# EAGLE design mbc_93_24_05_01 (EAGLE 7.6.0)

## Sheet 1 of 3
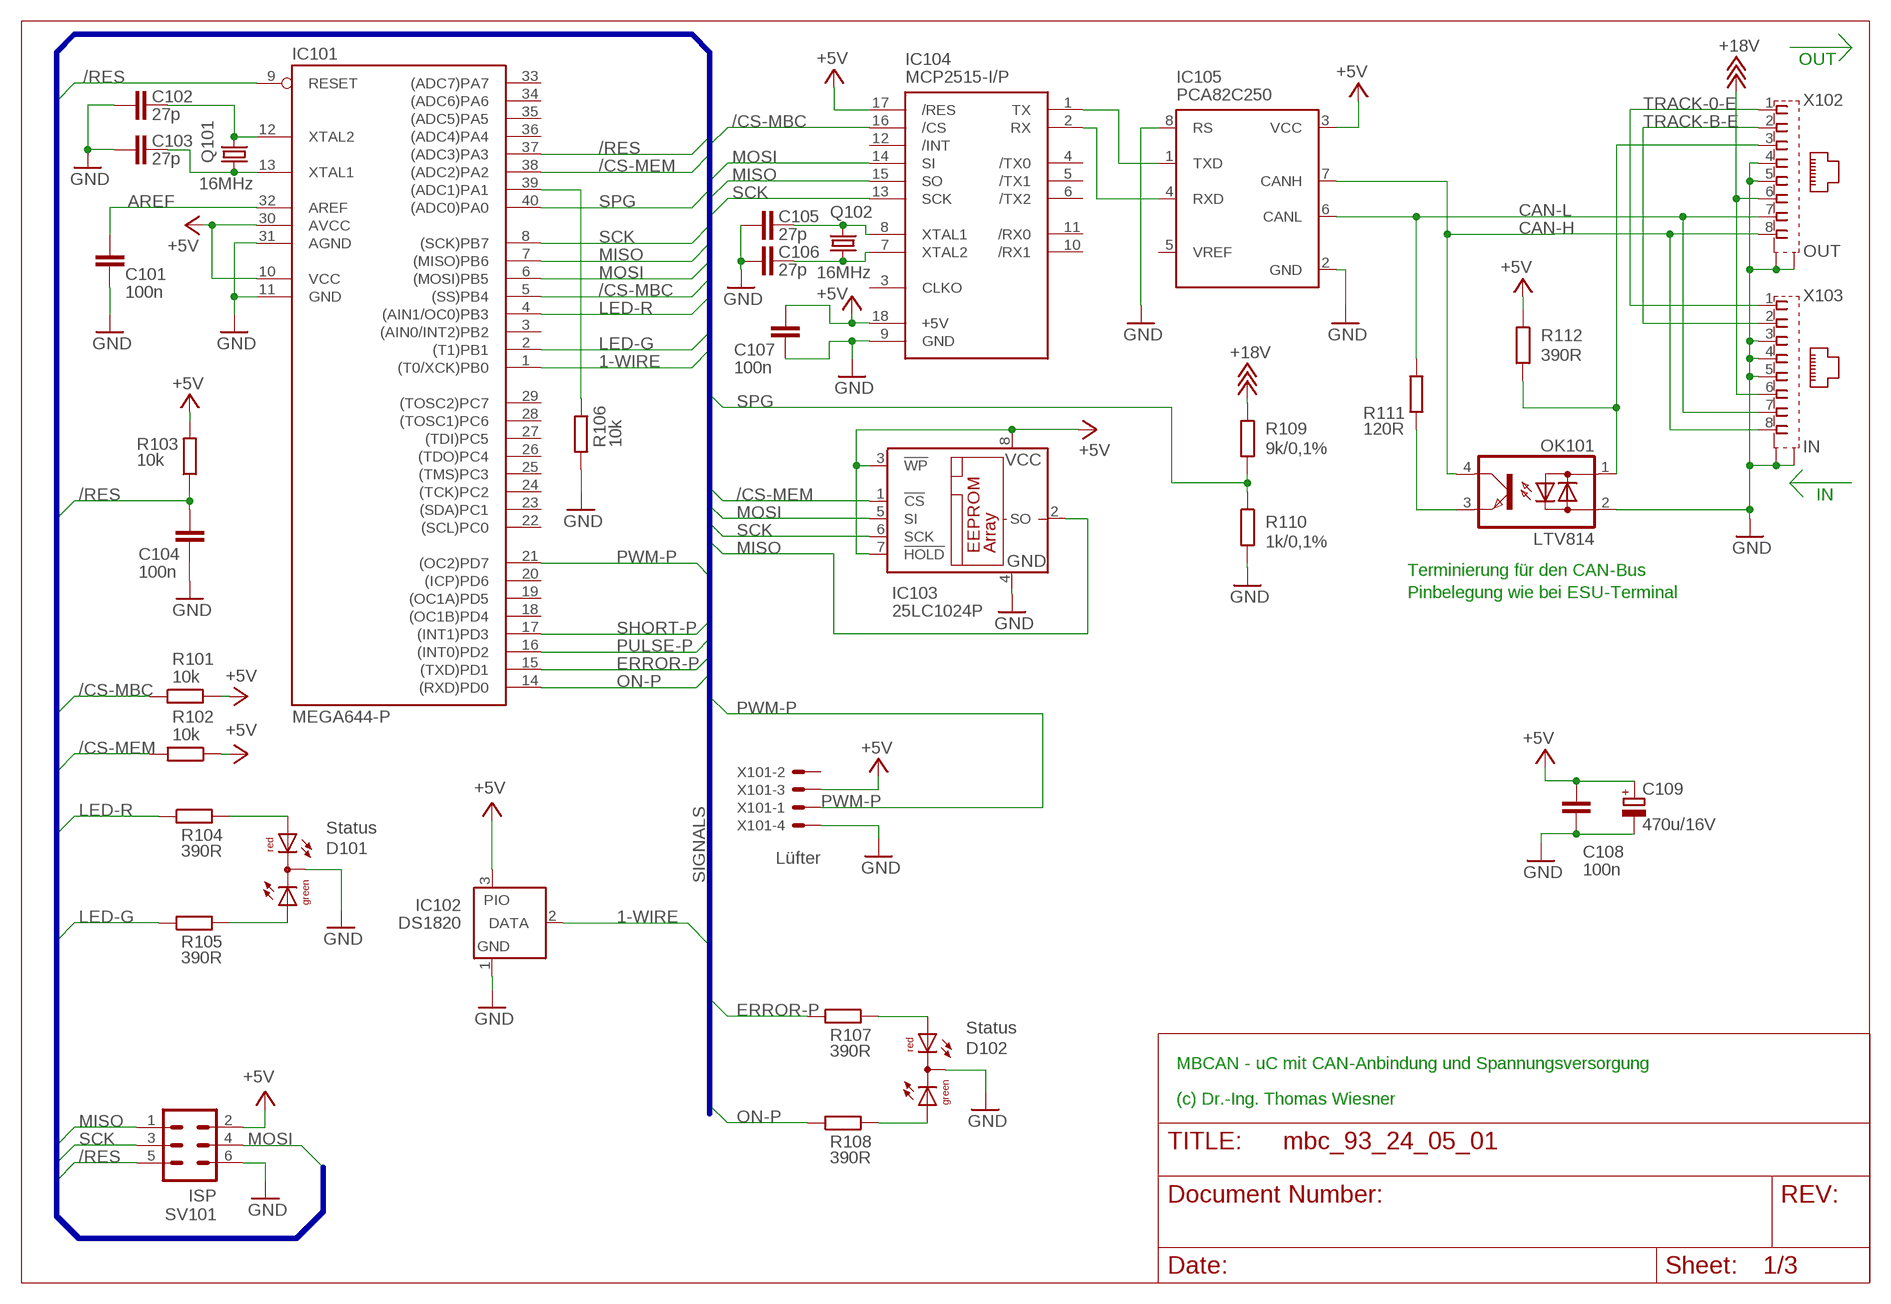
[diagram p0: schematic, sheet 1]

### Parts
C101  100n  C-EU025-025X050  [C025-025X050]
C102  27p  C-EU025-025X050  [C025-025X050]
C103  27p  C-EU025-025X050  [C025-025X050]
C104  100n  C-EU025-025X050  [C025-025X050]
C105  27p  C-EU025-025X050  [C025-025X050]
C106  27p  C-EU025-025X050  [C025-025X050]
C107  100n  C-EU025-025X050  [C025-025X050]
C108  100n  C-EU025-025X050  [C025-025X050]
C109  470u/16V  CPOL-EUE3.5-8  [E3,5-8]
D101  Status  DUOLED5MM  [DUOLED5MM]
D102  Status  DUOLED5MM  [DUOLED5MM]
IC101  MEGA644-P  MEGA323-P  [DIL40]
IC102  DS1820  DS2405  [TO92-]
IC103  25LC1024P  25LC040P  [DIL8]
IC104  MCP2515-I/P  MCP2510-I/P  [DIL18]
IC105  PCA82C250  [DIL08]
OK101  LTV814  PC814  [DIL04]
Q101  16MHz  CRYSTALHC49U-V  [HC49U-V]
Q102  16MHz  CRYSTALHC49U-V  [HC49U-V]
R101  10k  R-EU_0207/10  [0207/10]
R102  10k  R-EU_0207/10  [0207/10]
R103  10k  R-EU_0207/10  [0207/10]
R104  390R  R-EU_0207/10  [0207/10]
R105  390R  R-EU_0207/10  [0207/10]
R106  10k  R-EU_0207/10  [0207/10]
R107  390R  R-EU_0207/10  [0207/10]
R108  390R  R-EU_0207/10  [0207/10]
R109  9k/0,1%  R-EU_0207/10  [0207/10]
R110  1k/0,1%  R-EU_0207/10  [0207/10]
R111  120R  R-EU_0207/10  [0207/10]
R112  390R  R-EU_0207/10  [0207/10]
SV101  ISP  ML6  [ML6]
X101  Lüfter  22-23-2041  [22-23-2041]
X102  OUT  0446200002  [0446200002]
X103  IN  0446200002  [0446200002]

### Nets
1-WIRE: IC101.1((T0/XCK)PB0) IC102.2(DATA)
+5V: C107.1 C108.1 C109.+ IC101.10(VCC) IC101.30(AVCC) IC102.3(PIO) IC103.3(!WP) IC103.7(!HOLD) IC103.8(VCC) IC104.17(/RES) IC104.18(+5V) IC105.3(VCC) R101.2 R102.1 R103.2 R112.1 SV101.2 X101.3 ; also sheet 2,3
+18V: R109.1 X102.6 X103.6
/CS-MBC: IC101.5((SS)PB4) IC104.16(/CS) R101.1
/CS-MEM: IC101.38((ADC2)PA2) IC103.1(!CS) R102.2
/RES: C104.1 IC101.9(RESET) IC101.37((ADC3)PA3) R103.1 SV101.5
AREF: C101.1 IC101.32(AREF)
CAN-H: IC105.7(CANH) OK101.4(C) X102.8 X103.8
CAN-L: IC105.6(CANL) R111.2 X102.7 X103.7
ERROR-P: IC101.15((TXD)PD1) R107.1
GND: C101.2 C102.2 C103.2 C104.2 C105.2 C106.2 C107.2 C108.2 C109.- D101.K(C) D102.K(C) IC101.11(GND) IC101.31(AGND) IC102.1(GND) IC103.4(GND) IC104.9(GND) IC105.2(GND) IC105.8(RS) OK101.2(AC2) R106.1 R110.2 SV101.6 X101.4 X102.4 X102.5 X102.S@1(S1) X102.S@2(S2) X103.3 X103.4 X103.5 X103.S@1(S1) X103.S@2(S2) ; also sheet 2,3
LED-G: IC101.2((T1)PB1) R105.1
LED-R: IC101.4((AIN1/OC0)PB3) R104.1
MISO: IC101.7((MISO)PB6) IC103.2(SO) IC104.15(SO) SV101.1
MOSI: IC101.6((MOSI)PB5) IC103.5(SI) IC104.14(SI) SV101.4
N$1: C103.1 IC101.13(XTAL1) Q101.1
N$5: C102.1 IC101.12(XTAL2) Q101.2
N$6: C105.1 IC104.8(XTAL1) Q102.2
N$7: C106.1 IC104.7(XTAL2) Q102.1
N$9: IC101.39((ADC1)PA1) R106.2
N$23: D101.AR R104.2
N$27: D101.AG R105.2
N$29: IC104.1(TX) IC105.1(TXD)
N$30: IC104.2(RX) IC105.4(RXD)
N$32: OK101.3(E) R111.1
N$33: OK101.1(AC1) R112.2 X102.3
N$55: D102.AR R107.2
N$56: D102.AG R108.2
ON-P: IC101.14((RXD)PD0) R108.1 ; also sheet 2,3
PULSE-P: IC101.16((INT0)PD2) ; also sheet 2
PWM-P: IC101.21((OC2)PD7) X101.1
SCK: IC101.8((SCK)PB7) IC103.6(SCK) IC104.13(SCK) SV101.3
SHORT-P: IC101.17((INT1)PD3) ; also sheet 2,3
SPG: IC101.40((ADC0)PA0) R109.2 R110.1
TRACK-0-E: X102.1 X103.1 ; also sheet 2
TRACK-B-E: X102.2 X103.2 ; also sheet 2
Unconnected: IC101.3((AIN0/INT2)PB2) IC101.18((OC1B)PD4) IC101.19((OC1A)PD5) IC101.20((ICP)PD6) IC101.22((SCL)PC0) IC101.23((SDA)PC1) IC101.24((TCK)PC2) IC101.25((TMS)PC3) IC101.26((TDO)PC4) IC101.27((TDI)PC5) IC101.28((TOSC1)PC6) IC101.29((TOSC2)PC7) IC101.33((ADC7)PA7) IC101.34((ADC6)PA6) IC101.35((ADC5)PA5) IC101.36((ADC4)PA4) IC104.3(CLKO) IC104.4(/TX0) IC104.5(/TX1) IC104.6(/TX2) IC104.10(/RX1) IC104.11(/RX0) IC104.12(/INT) IC105.5(VREF) X101.2

### Buses
SIGNALS

### Notes on the sheet
- OUT
- IN
- Terminierung für den CAN-Bus
- Pinbelegung wie bei ESU-Terminal
- MBCAN - uC mit CAN-Anbindung und Spannungsversorgung
- (c) Dr.-Ing. Thomas Wiesner

## Sheet 2 of 3
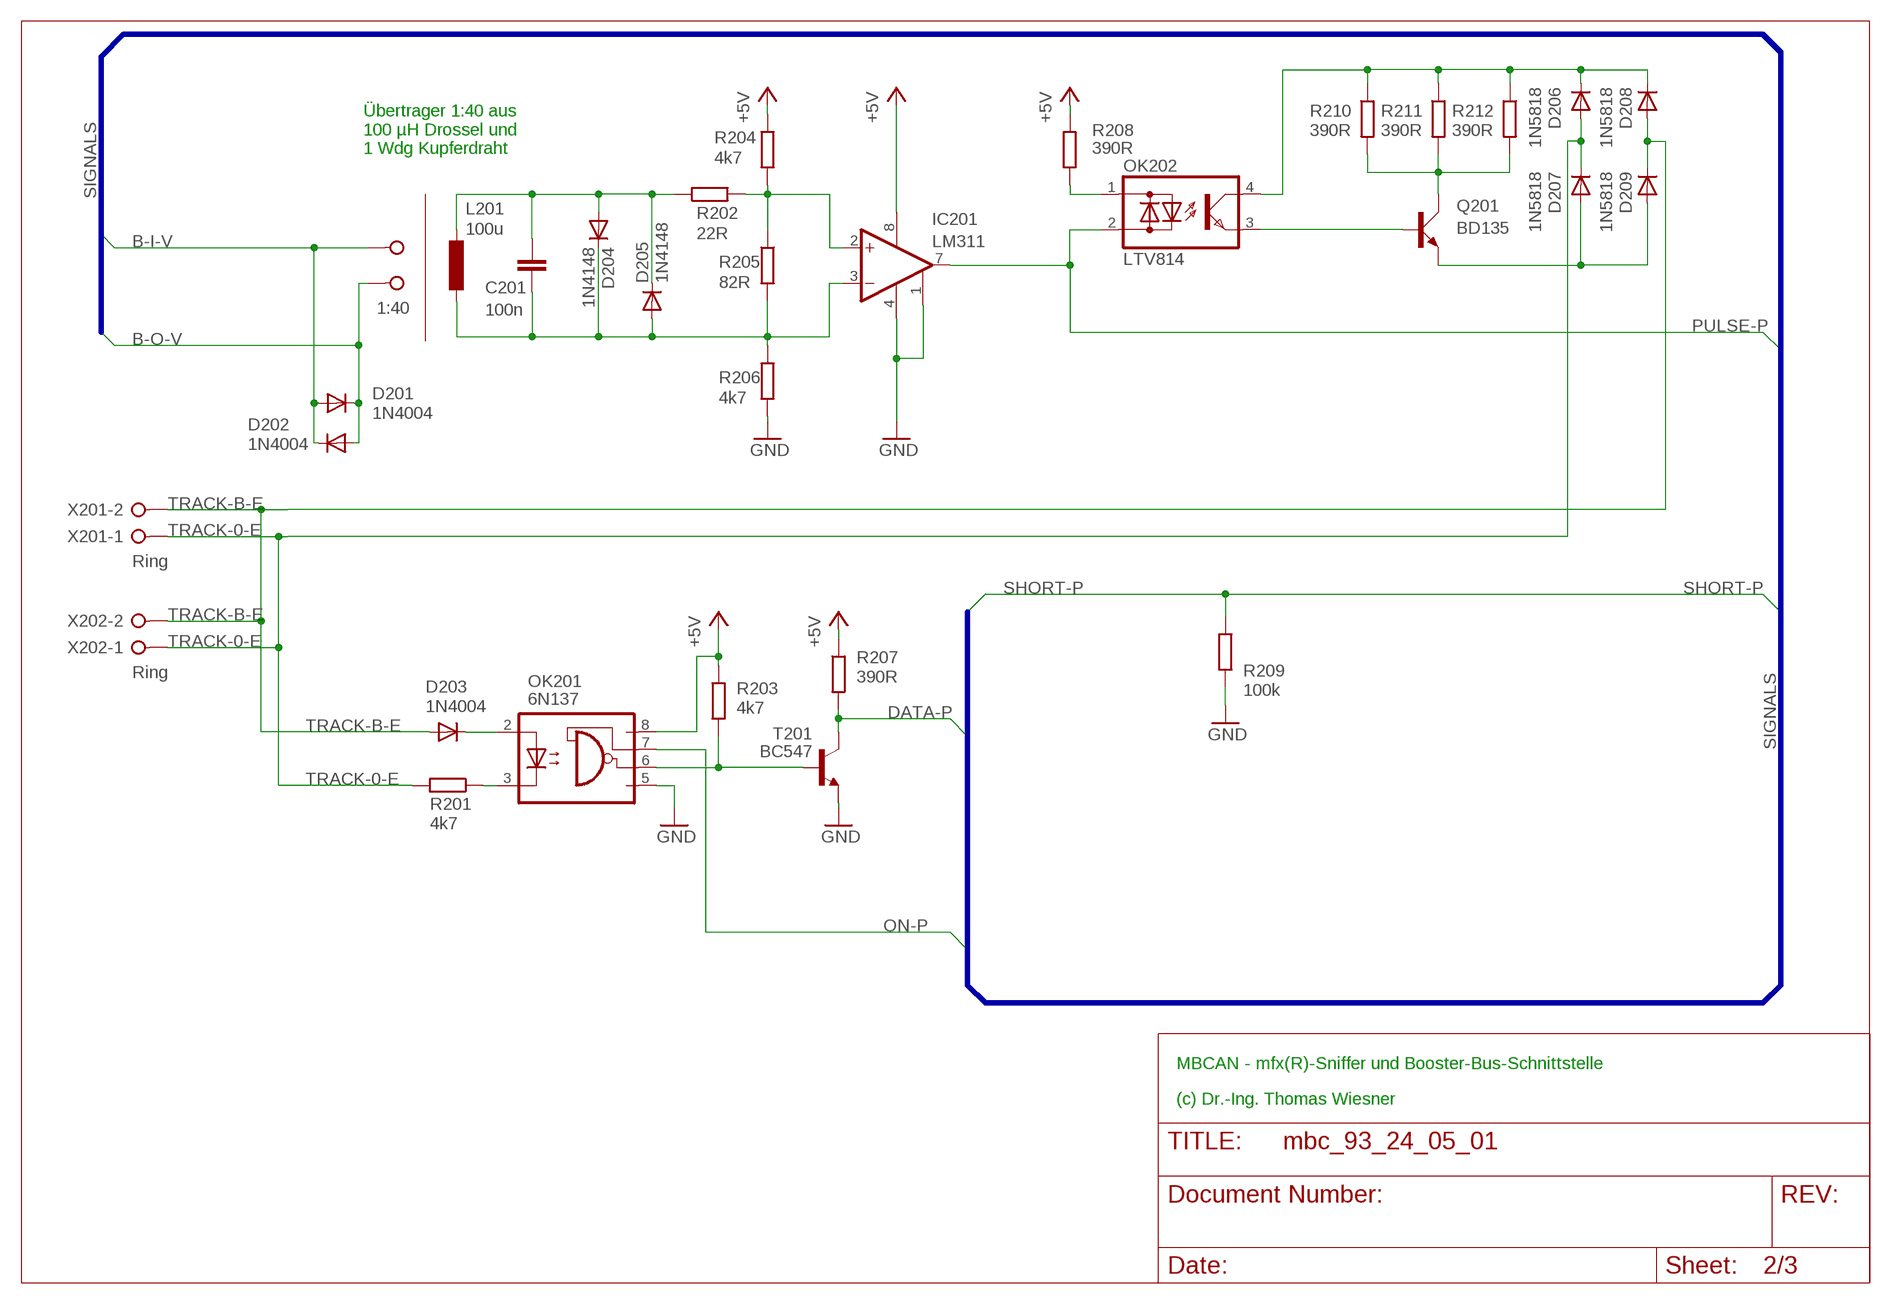
[diagram p1: schematic, sheet 2]

### Parts
C201  100n  C-EU025-025X050  [C025-025X050]
D201  1N4004  [DO41-10]
D202  1N4004  [DO41-10]
D203  1N4004  [DO41-10]
D204  1N4148  1N4148DO35-10  [DO35-10]
D205  1N4148  1N4148DO35-10  [DO35-10]
D206  1N5818  1N4004  [DO41-10]
D207  1N5818  1N4004  [DO41-10]
D208  1N5818  1N4004  [DO41-10]
D209  1N5818  1N4004  [DO41-10]
IC201  LM311  [DIL08]
L201  100u  L-EU6000-XXX-RC  [6000-XXXX-RC]
OK201  6N137  [DIL08]
OK202  LTV814  PC814  [DIL04]
Q201  BD135  BD139  [TO126AV]
R201  4k7  R-EU_0207/10  [0207/10]
R202  22R  R-EU_0207/10  [0207/10]
R203  4k7  R-EU_0207/10  [0207/10]
R204  4k7  R-EU_0207/10  [0207/10]
R205  82R  R-EU_0207/10  [0207/10]
R206  4k7  R-EU_0207/10  [0207/10]
R207  390R  R-EU_0207/10  [0207/10]
R208  390R  R-EU_0207/10  [0207/10]
R209  100k  R-EU_0207/10  [0207/10]
R210  390R  R-EU_0207/10  [0207/10]
R211  390R  R-EU_0207/10  [0207/10]
R212  390R  R-EU_0207/10  [0207/10]
T201  BC547  [TO92]
TP  1:40  W237-02P  [W237-132]
X201  Ring  W237-02P  [W237-132]
X202  Ring  W237-02P  [W237-132]

### Nets
+5V: IC201.8(V+) OK201.8(VCC) R203.1 R204.2 R207.1 R208.2 ; also sheet 1,3
B-I-V: D201.A D202.C TP.2 ; also sheet 3
B-O-V: D201.C D202.A TP.1 ; also sheet 3
DATA-P: R207.2 T201.3(C) ; also sheet 3
GND: IC201.1(EMIOUT) IC201.4(V-) OK201.5(GND) R206.2 R209.2 T201.1(E) ; also sheet 1,3
N$36: D206.C D208.C OK202.4(C) R210.1 R211.1 R212.1
N$37: D203.C OK201.2(A)
N$38: OK201.3(C) R201.1
N$39: C201.1 D204.A D205.C L201.1 R202.1
N$41: OK201.6(VO) R203.2 T201.2(B)
N$42: D207.A D209.A Q201.E
N$43: C201.2 D204.C D205.A IC201.3(-IN) L201.2 R205.2 R206.1
N$44: IC201.2(+IN) R202.2 R204.1 R205.1
N$45: OK202.3(E) Q201.B
N$46: Q201.C R210.2 R211.2 R212.2
N$50: OK202.1(AC1) R208.1
ON-P: OK201.7(VE) ; also sheet 1,3
PULSE-P: IC201.7(COLOUT) OK202.2(AC2) ; also sheet 1
SHORT-P: R209.1 ; also sheet 1,3
TRACK-0-E: D206.A D207.C R201.2 X201.1 X202.1 ; also sheet 1
TRACK-B-E: D203.A D208.A D209.C X201.2 X202.2 ; also sheet 1

### Buses
SIGNALS

### Notes on the sheet
- Übertrager 1:40 aus
  100 µH Drossel und 
  1 Wdg Kupferdraht
- MBCAN - mfx(R)-Sniffer und Booster-Bus-Schnittstelle
- (c) Dr.-Ing. Thomas Wiesner

## Sheet 3 of 3
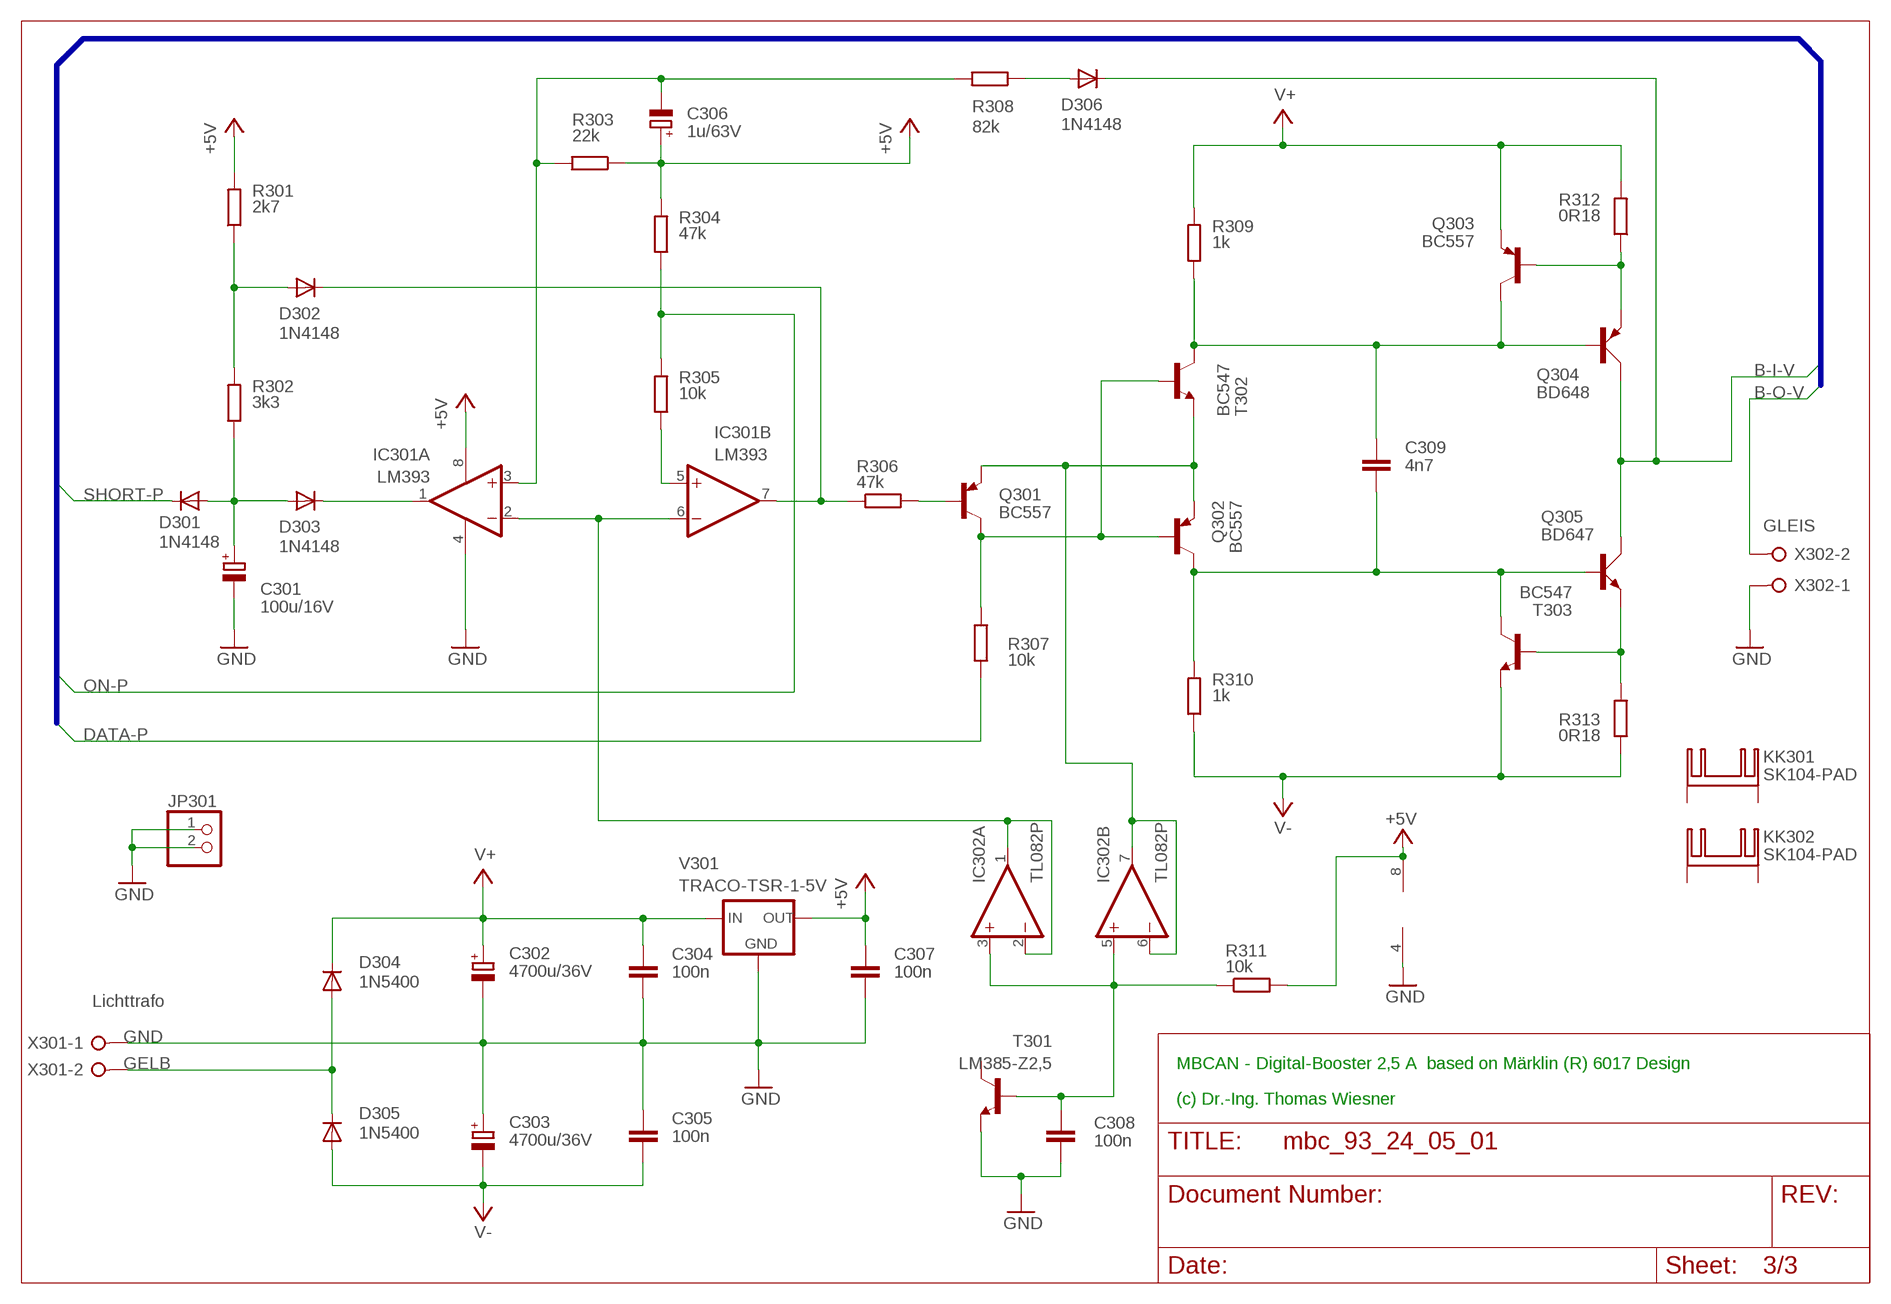
[diagram p2: schematic, sheet 3]

### Parts
C301  100u/16V  CPOL-EUE3.5-8  [E3,5-8]
C302  4700u/36V  CPOL-EUE7.5-16  [E7,5-16]
C303  4700u/36V  CPOL-EUE7.5-16  [E7,5-16]
C304  100n  C-EU025-024X044  [C025-024X044]
C305  100n  C-EU025-024X044  [C025-024X044]
C306  1u/63V  CPOL-EUE2.5-6  [E2,5-6]
C307  100n  C-EU025-024X044  [C025-024X044]
C308  100n  C-EU025-025X050  [C025-025X050]
C309  4n7  C-EU025-024X044  [C025-024X044]
D301  1N4148  1N4148DO35-7  [DO35-7]
D302  1N4148  1N4148DO35-7  [DO35-7]
D303  1N4148  1N4148DO35-7  [DO35-7]
D304  1N5400  [DO201-15]
D305  1N5400  [DO201-15]
D306  1N4148  1N4148DO35-7  [DO35-7]
IC301  LM393  [DIL08]
IC302  TL082P  [DIL08]
JP301  PINHD-1X2  [1X02]
KK301  SK104-PAD  [SK104-PAD]
KK302  SK104-PAD  [SK104-PAD]
Q301  BC557  [TO92]
Q302  BC557  [TO92]
Q303  BC557  [TO92]
Q304  BD648  TIP42C  [TO220AV]
Q305  BD647  TIP41C  [TO220AV]
R301  2k7  R-EU_0207/10  [0207/10]
R302  3k3  R-EU_0207/10  [0207/10]
R303  22k  R-EU_0207/10  [0207/10]
R304  47k  R-EU_0207/10  [0207/10]
R305  10k  R-EU_0207/10  [0207/10]
R306  47k  R-EU_0207/10  [0207/10]
R307  10k  R-EU_0207/10  [0207/10]
R308  82k  R-EU_0207/10  [0207/10]
R309  1k  R-EU_0207/10  [0207/10]
R310  1k  R-EU_0207/10  [0207/10]
R311  10k  R-EU_0207/10  [0207/10]
R312  0R18  R-EU_0414/15  [0414/15]
R313  0R18  R-EU_0414/15  [0414/15]
T301  LM385-Z2,5  BC547  [TO92]
T302  BC547  [TO92]
T303  BC547  [TO92]
V301  TRACO-TSR-1-5V  [TRACO-TSR-1]
X301  Lichttrafo  W237-02P  [W237-132]
X302  GLEIS  W237-02P  [W237-132]

### Nets
+5V: C306.+ C307.1 IC301.8(A:V+) IC302.8(P:V+) R301.2 R303.1 R304.2 R311.2 V301.OUT ; also sheet 1,2
B-I-V: D306.C Q304.C Q305.C ; also sheet 2
B-O-V: X302.2 ; also sheet 2
DATA-P: R307.1 ; also sheet 2
GELB: D304.A D305.C X301.2
GND: C301.- C302.- C303.+ C304.2 C305.1 C307.2 C308.2 IC301.4(A:V-) IC302.4(P:V-) JP301.1 JP301.2 T301.1(E) V301.GND X301.1 X302.1 ; also sheet 1,2
N$2: C309.1 Q303.3(C) Q304.B R309.1 T302.3(C)
N$3: Q303.2(B) Q304.E R312.1
N$4: Q305.E R313.2 T303.2(B)
N$8: C309.2 Q302.3(C) Q305.B R310.2 T303.3(C)
N$10: C308.1 IC302.3(A:+IN) IC302.5(B:+IN) R311.1 T301.2(B)
N$11: IC301.2(A:-IN) IC301.6(B:-IN) IC302.1(A:OUT) IC302.2(A:-IN)
N$15: IC301.5(B:+IN) R305.1
N$16: IC302.6(B:-IN) IC302.7(B:OUT) Q301.1(E) Q302.1(E) T302.1(E)
N$17: Q301.3(C) Q302.2(B) R307.2 T302.2(B)
N$18: Q301.2(B) R306.2
N$19: C306.- IC301.3(A:+IN) R303.2 R308.2
N$20: D306.A R308.1
N$22: D302.C IC301.7(B:COLOUT) R306.1
N$24: D303.C IC301.1(A:COLOUT)
N$25: C301.+ D301.A D303.A R302.1
N$26: D302.A R301.1 R302.2
ON-P: R304.1 R305.2 ; also sheet 1,2
SHORT-P: D301.C ; also sheet 1,2
V+: C302.+ C304.1 D304.C Q303.1(E) R309.2 R312.2 V301.IN
V-: C303.- C305.2 D305.A R310.1 R313.1 T303.1(E)
Unconnected: KK301.K1(K) KK301.K2(K) KK302.K1(K) KK302.K2(K) T301.3(C)

### Buses
B$1

### Notes on the sheet
- MBCAN - Digital-Booster 2,5 A  based on Märklin (R) 6017 Design
- (c) Dr.-Ing. Thomas Wiesner

## Library data of the parts
C101-C108 C201 C304 C305 C307-C309 = rcl:C-EU: CAPACITOR, European symbol
C109 C301-C303 C306 = rcl:CPOL-EU: POLARIZED CAPACITOR, European symbol
D101 D102 = led:DUOLED5MM: DUO LED 2 colors, 5 mm, round
D201-D203 D206-D209 = diode:1N4004: DIODE general purpose rectifier, 1 A
D204 D205 D301-D303 D306 = diode:1N4148: DIODE high speed (Philips)
D304 D305 = diode:1N5400: DIODE standard rectifier, 3 A, 50 V (Motorola)
IC101 = atmel:MEGA323-P: MICROCONTROLLER 32 Kbytes FLASH 2 Kbytes SRAM 1 Kbytes EEPROM USART 8-channel 10 bit ADC Source: avr.lbr; OC_FARNELL: unknown; OC_NEWARK: unknown
IC102 = maxim:DS2405: Addressable Switch DALLAS Semiconductor; MF: DALLAS SEMICONDUCTOR; MPN: DS2405; OC_FARNELL: 1188025; OC_NEWARK: 06F4645
IC103 = microchip:25*: Serial EEPROM 4K/ 8K , SPI bus; MF: MICROCHIP; MPN: 25LC040/P; OC_FARNELL: 9758100; OC_NEWARK: 96K4091
IC104 = mbc:MCP2510: BASIC-CAN 2.0a Controller Stand-alone CAN controller von Microchip
IC105 = micro-philips:PCA82C250: CAN CONTROLLER INTERFACE; OC_FARNELL: 3692358; OC_NEWARK: unknown
IC201 = mbc:LM311: DC-Comparator Single
IC301 = mbc:LM393: DC-Comparator Dual
IC302 = linear:TL082: OP AMP Data sheet <http://www.ti.com/lit/ds/symlink/tl084a . pdf>; DATA_SHEET: <a href="http://www.ti.com/lit/ds/symlink/tl084a.pdf"> Data sheet </a>
JP301 = pinhead:PINHD-1X2: PIN HEADER
KK301 KK302 = heatsink:SK104-PAD: HEATSINK manufacturer Fischer/distributor Buerklin
L201 = rcl:L-EU: INDUCTOR, European symbol
OK101 OK202 = optocoupler:PC814: SHARP OPTO COUPLER; OC_FARNELL: 9707662; OC_NEWARK: unknown
OK201 = optocoupler:6N137: MOTOROLA OPTO COUPLER; MPN: 6N137; OC_FARNELL: 1328376; OC_NEWARK: 52M1895
Q101 Q102 = crystal:CRYSTAL: CRYSTAL; OC_FARNELL: 1666969; OC_NEWARK: unknown
Q201 = transistor-power:BD139: NPN TRANSISTOR
Q301-Q303 = transistor-pnp:BC557: PNP Transistor
Q304 = transistor-power:TIP42C: PNP TRANSISTOR
Q305 = transistor-power:TIP41C: NPN TRANSISTOR
R101-R112 R201-R212 = resistor:R-EU_: RESISTOR, European symbol
R301-R313 = rcl:R-EU_: RESISTOR, European symbol
SV101 = con-ml:ML6: HARTING; OC_FARNELL: unknown; OC_NEWARK: unknown
T201 T301-T303 = transistor:BC547: NPN TRANSISTOR
TP X201 X202 X301 X302 = con-wago-508:W237-02P: WAGO SREW CLAMP; OC_FARNELL: unknown; OC_NEWARK: unknown
V301 = mbc:TRACO-TSR-1-5V: Spannungsregler Hersteller: TRACO Typ: TSR-1 5V: TSR 1-2450 Spg: 5V Strom: 1A Reichelt TSR 1-2450
X101 = con-molex:22-23-2041: .100" (2.54mm) Center Header - 4 Pin; MF: MOLEX; MPN: 22-23-2041; OC_FARNELL: 1462920; OC_NEWARK: 38C0355
X102 X103 = mbc:0446200002: RJ-45 INVERTED MODULAR JACK ASSEMBLY WITH RJ-11 KEEPOUT FEATURE Source: Data sheet <http://www.farnell.com/datasheets/73207.pdf> MOLEX 0446200002 BUCHSE, RJ45, GESCHIRMT Source: Farnell <http://de.farnell.com/molex/0446200002/buchse-rj45-geschirmt/dp/9251910?ost=9251910>; MF: MOLEX; MPN: 0446200002; OC_FARNELL: 9251910

## Board
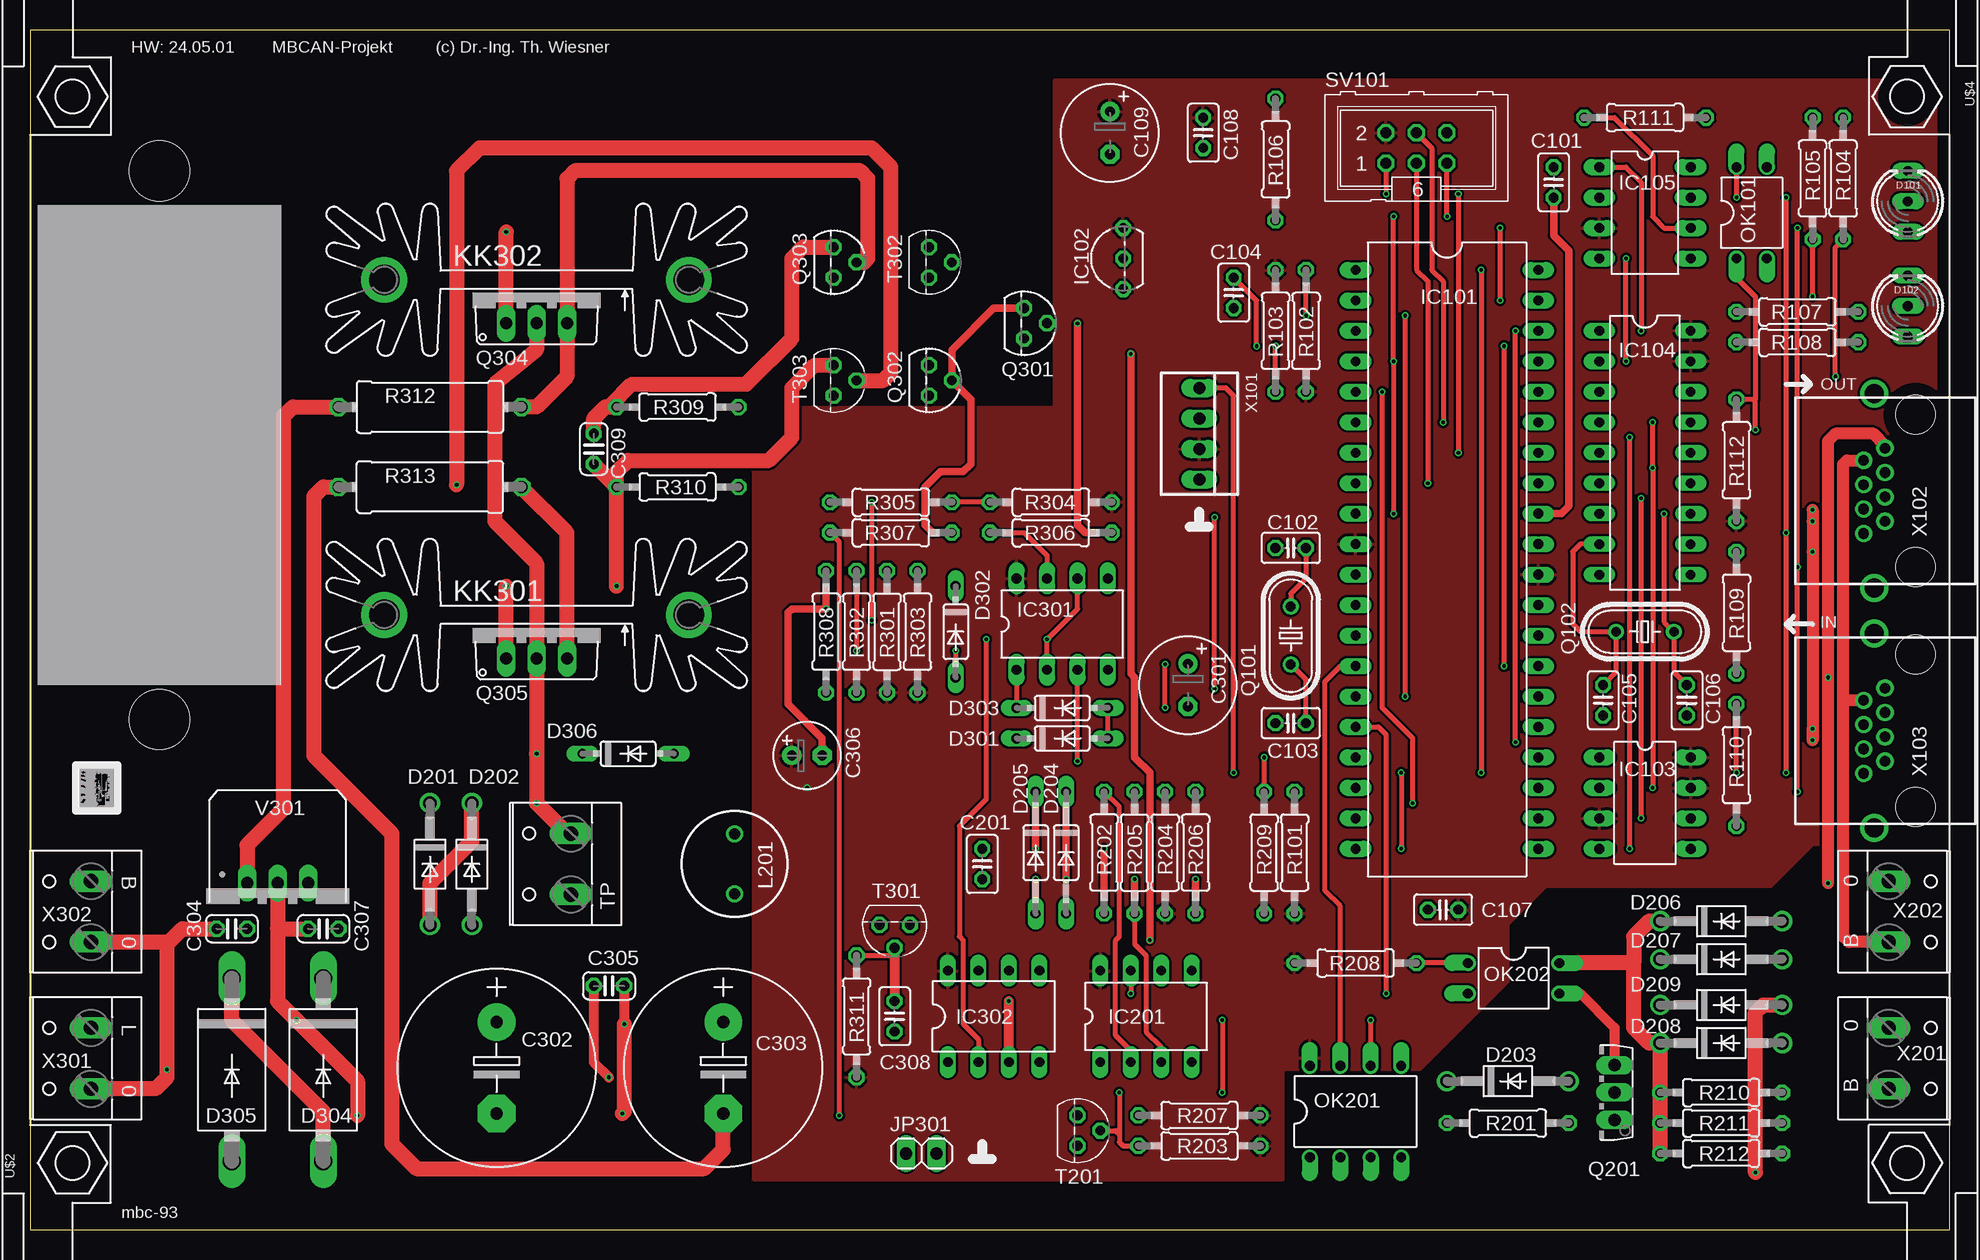
[diagram p3: board, top side]
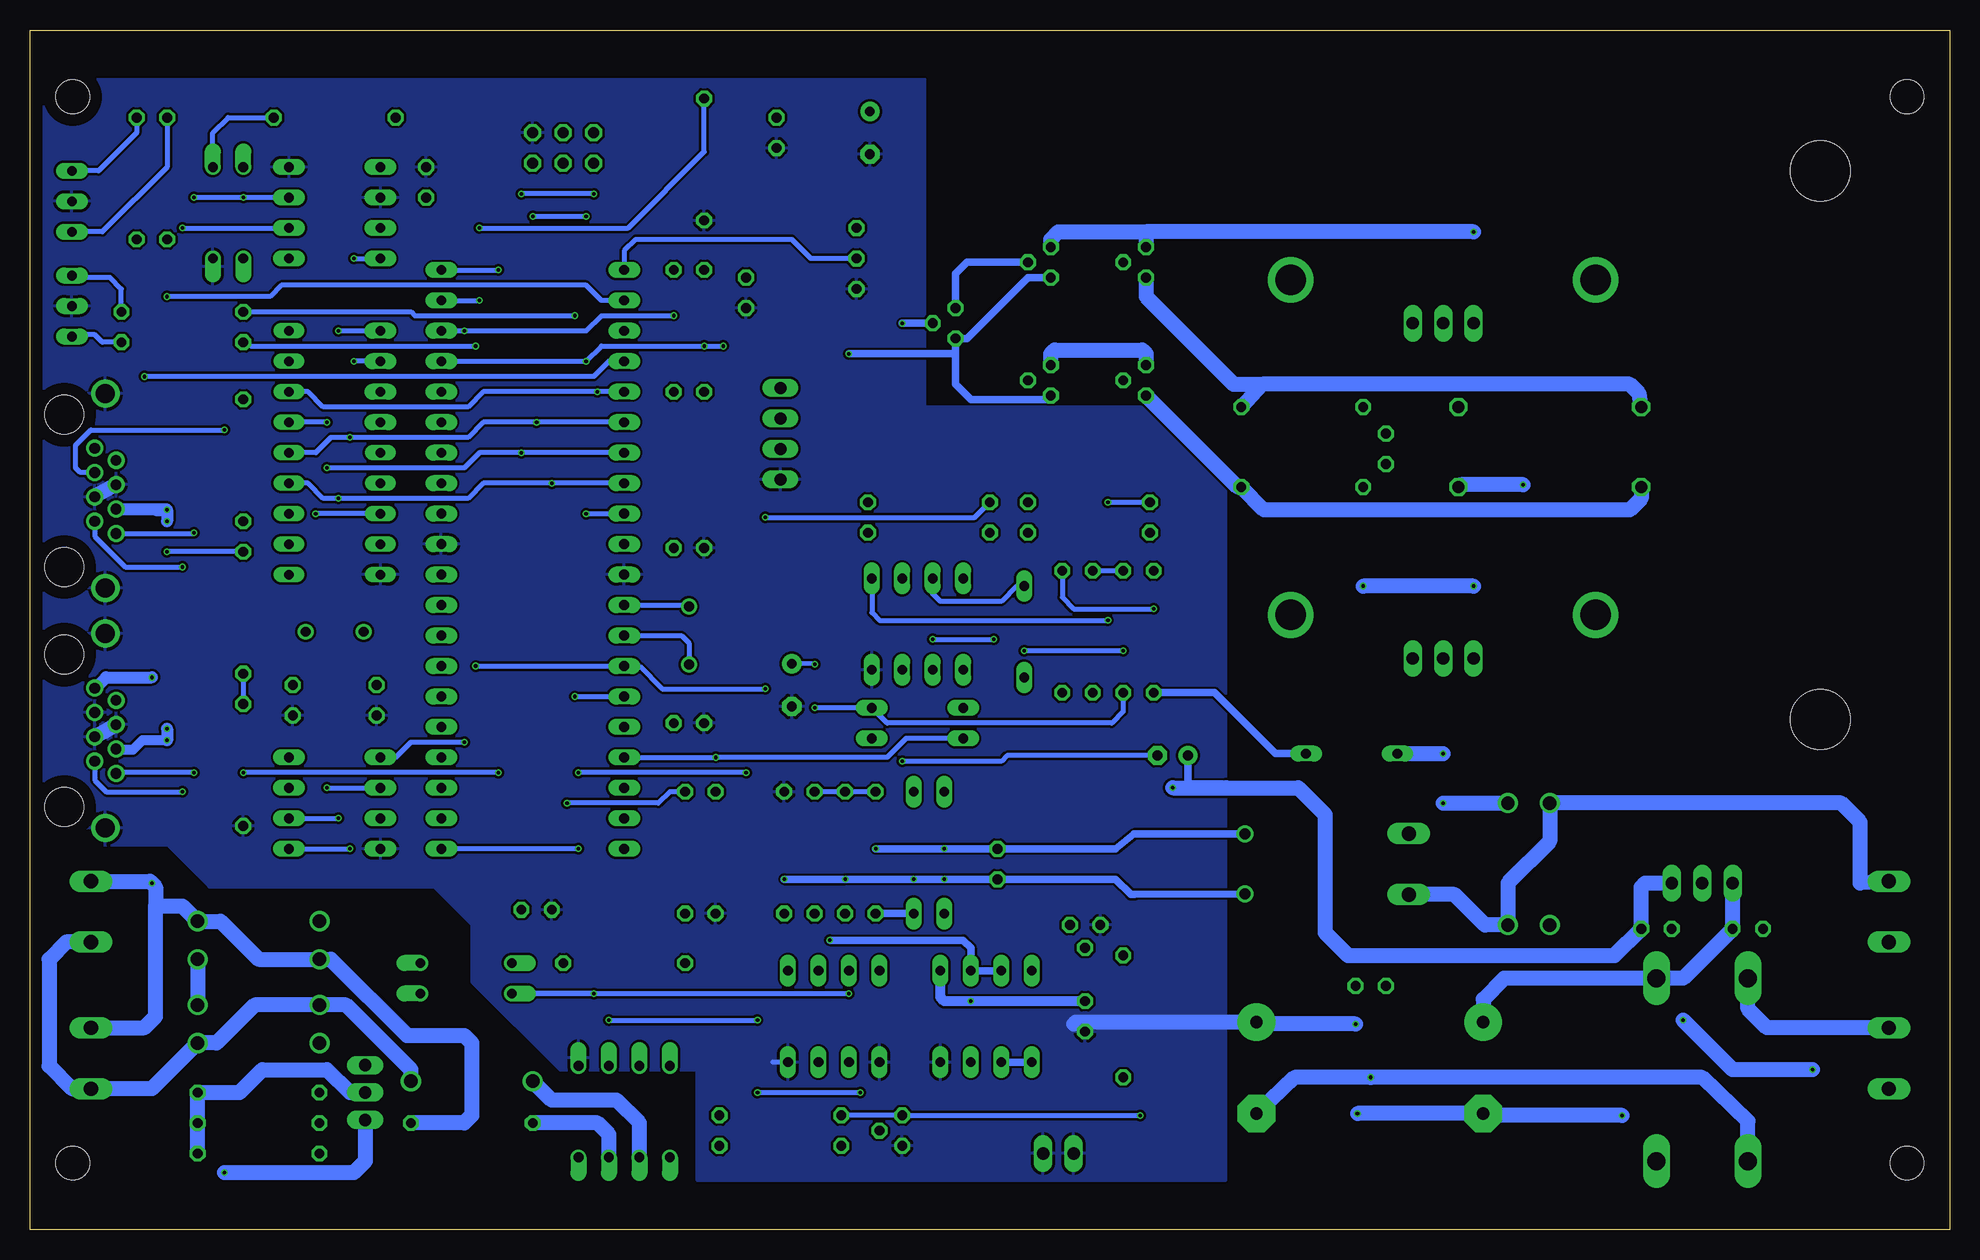
[diagram p4: board, bottom side, seen from below]

Size 160.02 x 100.01 mm. Coordinates in mm from the lower left corner, seen from the top.
Outline: 0,0 160.02,0 160.02,100.01 0,100.01 0,0
Copper layers (1*16): Top 0.035mm / dielectric 1.5mm / Bottom 0.035mm
Design rules "default *": minimum track width 10mil, minimum drill 0.3mm, track to track 8mil, track to pad 8mil, pad to pad 8mil, via to via 8mil, smd to smd 8mil, copper to edge 40mil, drill to drill 8mil, minimum pad ring 10mil, minimum via ring 0.125mm, stop-mask expansion 4mil, vias tented up to drill 0mil, thermal gap 10mil
Holes 5 mm at 10.79,88.27 10.79,42.55

### Footprints (pad centres in the part's own frame; a part is rotated, then mirrored left to right if it is on the bottom)
C025-025X050 = drill 0.813 octagon: 1 -1.27,0; 2 1.27,0
E3,5-8 = drill 0.813 pad 1.6: + -1.778,0 | drill 0.813 pad 1.6 octagon: - 1.778,0
E7,5-16 = drill 1.016 pad 3.15: + -3.81,0 | drill 1.016 pad 3.15 octagon: - 3.81,0
C025-024X044 = drill 0.813 octagon: 1 -1.27,0; 2 1.27,0
E2,5-6 = drill 0.813 pad 1.6: + -1.27,0 | drill 0.813 pad 1.6 octagon: - 1.27,0
DUOLED5MM = drill 0.813 long: AG -2.54,0; AR 2.54,0; K 0,0
DO41-10 = drill 1.118: A 5.08,0; C -5.08,0
DO35-10 = drill 0.813 long: A 5.08,0; C -5.08,0
DO35-7 = drill 0.813 long: A 3.81,0; C -3.81,0
DO201-15 = drill 1.499 long: A 7.62,0; C -7.62,0
DIL40 = drill 0.813 long: 1 -24.13,-7.62; 2 -21.59,-7.62; 3 -19.05,-7.62; 4 -16.51,-7.62; 5 -13.97,-7.62; 6 -11.43,-7.62; 7 -8.89,-7.62; 8 -6.35,-7.62; 9 -3.81,-7.62; 10 -1.27,-7.62; 11 1.27,-7.62; 12 3.81,-7.62; 13 6.35,-7.62; 14 8.89,-7.62; 15 11.43,-7.62; 16 13.97,-7.62; 17 16.51,-7.62; 18 19.05,-7.62; 19 21.59,-7.62; 20 24.13,-7.62; 21 24.13,7.62; 22 21.59,7.62; 23 19.05,7.62; 24 16.51,7.62; 25 13.97,7.62; 26 11.43,7.62; 27 8.89,7.62; 28 6.35,7.62; 29 3.81,7.62; 30 1.27,7.62; 31 -1.27,7.62; 32 -3.81,7.62; 33 -6.35,7.62; 34 -8.89,7.62; 35 -11.43,7.62; 36 -13.97,7.62; 37 -16.51,7.62; 38 -19.05,7.62; 39 -21.59,7.62; 40 -24.13,7.62
TO92- = drill 0.813 octagon: 1 -2.54,0; 2 0,0; 3 2.54,0
DIL8 = drill 0.813 long: 1 -3.81,-3.81; 2 -1.27,-3.81; 3 1.27,-3.81; 4 3.81,-3.81; 5 3.81,3.81; 6 1.27,3.81; 7 -1.27,3.81; 8 -3.81,3.81
DIL18 = drill 0.813 long: 1 -10.16,-3.81; 2 -7.62,-3.81; 3 -5.08,-3.81; 4 -2.54,-3.81 | drill 0.8 long: 5 0,-3.81; 6 2.54,-3.81; 7 5.08,-3.81; 8 7.62,-3.81; 9 10.16,-3.81; 10 10.16,3.81; 11 7.62,3.81; 12 5.08,3.81; 13 2.54,3.81; 14 0,3.81; 15 -2.54,3.81; 16 -5.08,3.81; 17 -7.62,3.81; 18 -10.16,3.81
DIL08 = drill 0.813 long: 1 -3.81,-3.81; 2 -1.27,-3.81; 3 1.27,-3.81; 4 3.81,-3.81; 5 3.81,3.81; 6 1.27,3.81; 7 -1.27,3.81; 8 -3.81,3.81
DIL08' = drill 0.813 pad 1.27 long: 1 -3.81,-3.81; 2 -1.27,-3.81; 3 1.27,-3.81; 4 3.81,-3.81; 5 3.81,3.81; 6 1.27,3.81; 7 -1.27,3.81; 8 -3.81,3.81
1X02 = drill 1.016 long: 1 -1.27,0; 2 1.27,0
SK104-PAD = drill 2.54 pad 3.81: K1 -12.7,-0.762; K2 12.7,-0.762
6000-XXXX-RC = drill 0.9 pad 1.422: 1 -2.5,0; 2 2.5,0
DIL04 = drill 0.813 offset: 1 -1.27,-3.81; 2 1.27,-3.81; 3 1.27,3.81; 4 -1.27,3.81
DIL08'' = drill 0.813 offset: 1 -3.81,-3.81; 2 -1.27,-3.81; 3 1.27,-3.81; 4 3.81,-3.81; 5 3.81,3.81; 6 1.27,3.81; 7 -1.27,3.81; 8 -3.81,3.81
HC49U-V = drill 0.813: 1 -2.413,0; 2 2.413,0
TO126AV = drill 1.016 long: B 2.286,-1.27; C 0,-1.27; E -2.286,-1.27
TO92 = drill 0.813 octagon: 1 1.27,0; 2 0,1.905; 3 -1.27,0
TO220AV = drill 1.016 long: B -2.54,-2.54; C 0,-2.54; E 2.54,-2.54
0207/10 = drill 0.813 octagon: 1 -5.08,0; 2 5.08,0
0414/15 = drill 1.016 octagon: 1 -7.62,0; 2 7.62,0
ML6 = drill 0.914 octagon: 1 -2.54,-1.27; 2 -2.54,1.27; 3 0,-1.27; 4 0,1.27; 5 2.54,-1.27; 6 2.54,1.27
W237-132 = drill 1.194 long: 1 -2.54,-0.635; 2 2.54,-0.635
FPH = hole 2.794: 3.556,44.45; 3.556,-44.45
TRACO-TSR-1 = drill 1.016 long: GND 0,2.54; IN -2.54,2.54; OUT 2.54,2.54
22-23-2041 = drill 1 long: 1 -3.81,0; 2 -1.27,0; 3 1.27,0; 4 3.81,0
0446200002 = drill 0.889 pad 1.422: 1 3.556,2.54; 2 2.54,4.318; 3 1.524,2.54; 4 0.508,4.318; 5 -0.508,2.54; 6 -1.524,4.318; 7 -2.54,2.54; 8 -3.556,4.318 | drill 1.575 pad 2.286: S@1 -8.103,3.429; S@2 8.103,3.429 | hole 3.251: 6.35,0; -6.35,0

### Placement (x,y rotation side)
C101  127,87.31 90 top
C102  105.09,56.83 180 top
C103  105.09,42.23 180 top
C104  100.33,78.11 270 top
C105  131.13,44.13 270 top
C106  138.11,44.13 270 top
C107  117.79,26.67 180 top
C108  97.79,91.44 270 top
C109  90.01,91.44 270 top
C201  79.38,30.48 270 top
C301  96.52,45.4 270 top
C302  38.89,13.49 270 top
C303  57.78,13.49 270 top
C304  16.83,25.08 180 top
C305  48.26,20.32 180 top
C306  64.77,39.53 0 top
C307  24.45,25.08 180 top
C308  72.07,17.78 270 top
C309  46.99,65.09 270 top
D101  156.53,85.72 90 top
D102  156.53,76.99 90 top
D201  33.34,30.48 270 top
D202  36.83,30.48 270 top
D203  123.19,12.38 0 top
D204  86.36,31.43 270 top
D205  83.82,31.43 270 top
D206  140.97,25.72 0 top
D207  140.97,22.54 0 top
D208  140.97,15.56 0 top
D209  140.97,18.73 0 top
D301  86.04,40.96 0 top
D302  77.15,49.85 270 top
D303  86.04,43.5 0 top
D304  24.45,13.34 270 top
D305  16.83,13.34 270 top
D306  49.85,39.69 0 top
IC101  118.11,55.88 270 top
IC102  91.12,80.96 90 top
IC103  134.62,35.56 270 top
IC104  134.62,64.77 270 top
IC105  134.62,84.77 270 top
IC201  93.03,17.78 0 top
IC301  86.04,50.48 0 top
IC302  TL082P  [DIL08']  80.33,17.78 0 top
JP301  74.3,6.35 0 top
KK301  42.23,50.48 180 top
KK302  42.23,78.42 180 top
L201  58.74,30.48 270 top
OK101  143.51,84.77 0 top
OK201  6N137  [DIL08'']  110.49,9.84 0 top
OK202  123.67,20.95 270 top
Q101  105.09,49.53 90 top
Q102  134.62,49.85 180 top
Q201  130.81,11.43 90 top
Q301  82.87,75.56 270 top
Q302  74.93,70.8 270 top
Q303  66.99,80.64 270 top
Q304  42.23,78.11 0 top
Q305  42.23,50.16 0 top
R101  105.41,31.43 270 top
R102  106.36,74.93 90 top
R103  103.82,74.93 90 top
R104  151.13,87.63 90 top
R105  148.59,87.63 90 top
R106  103.82,89.22 90 top
R107  147.32,76.52 0 top
R108  147.32,73.98 0 top
R109  142.24,51.44 270 top
R110  142.24,38.73 270 top
R111  134.62,92.71 180 top
R112  142.24,64.14 90 top
R201  123.19,8.89 0 top
R202  89.53,31.43 90 top
R203  97.47,6.99 180 top
R204  94.61,31.43 270 top
R205  92.08,31.43 270 top
R206  97.16,31.43 90 top
R207  97.47,9.53 180 top
R208  110.49,22.23 180 top
R209  102.87,31.43 270 top
R210  140.97,11.43 0 top
R211  140.97,8.89 0 top
R212  140.97,6.35 0 top
R301  71.44,49.85 270 top
R302  68.9,49.85 90 top
R303  73.98,49.85 90 top
R304  85.09,60.64 0 top
R305  71.75,60.64 0 top
R306  85.09,58.1 0 top
R307  71.75,58.1 0 top
R308  66.36,49.85 90 top
R309  53.98,68.58 0 top
R310  53.98,61.91 180 top
R311  68.9,17.78 270 top
R312  33.34,68.58 180 top
R313  33.34,61.91 0 top
SV101  115.57,90.17 0 top
T201  87.31,8.26 270 top
T301  72.07,25.4 180 top
T302  74.93,80.64 270 top
T303  66.99,70.8 270 top
TP  44.45,30.48 90 top
U$2  [FPH]  0,50.01 0 top
U$4  [FPH]  160.02,50.01 180 top
V301  20.64,26.35 0 top
X101  97.47,66.36 270 top
X102  157.16,61.59 90 top
X103  157.16,41.59 90 top
X201  155.57,14.29 270 top
X202  155.57,26.51 270 top
X301  4.45,14.29 90 top
X302  4.45,26.51 90 top

### Tracks (layer width: path | path; a pad name or v marks a point on that pad's centre or on a via)
1-WIRE
  Bottom 0.406: IC102.2 94.93,80.96 96.52,82.55 109.54,82.55 110.49,81.6 IC101.1
+5V  (via drill 0.3)
  Bottom 0.61: C306.+ 63.5,37.15 60.64,37.15 60.33,36.83
  Bottom 1.27: V301.OUT 25.4,28.89 25.72,28.57 C307.1 27.94,22.86 50.16,22.86 52.07,24.77 52.07,34.61 54.29,36.83 60.33,36.83 v64.77,36.83
  pour Top: 85.41,95.89 160.02,95.89 160.02,32.07 148.59,32.07 145.1,28.57 126.36,28.57 123.19,25.4 123.19,20.64 115.89,13.34 104.46,13.34 104.46,4.13 60.33,4.13 60.33,68.58 85.41,68.58
+18V  (via drill 0.3)
  Top 1.016: v148.59,60.01 v148.59,59.05 v148.59,56.52 v148.59,40.8 v148.59,41.75
  Bottom 0.406: R109.1 v148.59,56.52
  Bottom 0.813: v148.59,40.8 150.65,40.8 151.45,40.01 152.78,40.01 X103.6
  Bottom 1.016: X102.6 148.65,60.07 v148.59,60.01 | v148.59,41.75 v148.59,40.8 | 149.54,60.01 v148.59,60.01 | v148.59,60.01 v148.59,59.05
/CS-MBC  (via drill 0.3)
  Top 0.406: v115.25,35.56 115.25,40.96 112.71,43.5 v112.71,69.85
  Bottom 0.406: IC101.5 v112.71,69.85 122.24,69.85 123.51,68.58 135.57,68.58 136.84,69.85 IC104.16 | R101.1 106.68,36.51 107.63,35.56 v115.25,35.56
/CS-MEM  (via drill 0.3)
  Top 0.406: v106.36,76.2 R102.2 | v123.83,40.64 v123.83,74.93
  Bottom 0.406: IC101.38 v123.83,74.93 113.67,74.93 112.39,76.2 v106.36,76.2 | IC103.1 129.54,39.37 128.27,40.64 v123.83,40.64
/RES  (via drill 0.3)
  Top 0.406: v113.67,59.69 v113.67,72.39 v113.67,84.45 | v118.11,84.45 SV101.5 | v102.23,73.66 102.23,77.47 C104.1 | R103.1 v103.82,73.66
  Bottom 0.406: IC101.37 v113.67,72.39 112.39,73.66 v103.82,73.66 v102.23,73.66 | v113.67,59.69 IC101.9 | v113.67,84.45 v118.11,84.45
AREF
  Top 0.61: C101.1 127,82.87 128.27,81.6 128.27,60.33 127.64,59.69 IC101.32
B-I-V  (via drill 0.3)
  Top 1.27: TP.2 44.77,33.02 v42.23,35.56 v42.23,39.69 Q305.C 42.23,55.56 38.73,59.05 38.73,70.48 42.23,73.34 Q304.C | D201.A 33.34,28.89 36.83,32.38 D202.C
  Bottom 1.27: v42.23,35.56 D202.C | D306.C v42.23,39.69
B-O-V
  Bottom 1.27: X302.2 7.46,28.89 7.46,33.97 9.05,35.56 D201.C 33.34,32.38 36.83,28.89 D202.A 38.73,25.4 41.27,27.94 TP.1
CAN-H  (via drill 0.3)
  Top 0.406: v146.37,86.04 v146.37,58.1 v146.37,38.1 | OK101.4 v142.24,86.04
  Bottom 0.406: IC105.7 v142.24,86.04 v146.37,86.04 | v146.37,38.1 152.78,38.1 X103.8 | X102.8 146.43,58.04 v146.37,58.1
CAN-L  (via drill 0.3)
  Top 0.406: v147.32,36.51 v147.32,55.24 v147.32,83.5 | R111.2 132.08,92.71 135.25,89.53 135.25,84.45 136.21,83.5 IC105.6
  Bottom 0.406: X103.7 154.62,37.47 153.67,36.51 v147.32,36.51 | v147.32,83.5 IC105.6 | X102.7 154.62,57.78 152.08,55.24 v147.32,55.24
DATA-P  (via drill 0.3)
  Top 0.406: v67.47,9.53 67.47,57.31 R307.1
  Bottom 0.406: v67.47,9.53 T201.3 R207.2
ERROR-P  (via drill 0.3)
  Top 0.406: v114.62,76.2 v114.62,44.45
  Bottom 0.406: R107.1 128.27,76.52 127.95,76.2 v114.62,76.2 | v114.62,44.45 IC101.15
GELB
  Top 1.27: D304.A 24.45,9.84 16.83,17.46 D305.C
  Bottom 1.27: X301.2 15.24,16.83 16.83,18.41 D305.C
GND  (via drill 0.3)
  Top 0.813: C305.1 v49.53,17.14
  Top 1.27: 11.43,23.81 v11.43,13.34 11.43,12.7 10.48,11.75 X301.1 | 11.43,23.81 12.7,25.08 C304.2 | X302.1 11.27,23.97 11.43,23.81 | V301.GND 20.64,25.08 | 20.64,25.08 20.64,19.05 v22.23,17.46 27.3,12.38 v27.3,9.53 | 20.64,25.08 C307.2 | v49.53,17.14 49.53,9.84 v49.37,9.68
  Bottom 0.406: IC201.4 98.11,13.97
  Bottom 0.61: C302.- 38.73,9.53
  Bottom 1.27: X102.4 154.59,61.15 154.62,61.12 154.59,61.12 X102.5 | X103.4 153.92,41.47 X103.5 | C302.- v49.37,9.68 | v49.53,17.14 57.47,17.14 C303.+ 72.87,17.3 73.03,17.14 | v27.3,9.53 38.73,9.53 | v11.43,13.34 18.1,13.34 v22.23,17.46
  pour Bottom: 160.02,95.89 160.02,32.07 148.59,32.07 145.1,28.57 126.36,28.57 123.19,25.4 123.19,20.64 115.89,13.34 104.46,13.34 104.46,4.13 60.33,4.13 60.33,68.58 85.41,68.58 85.41,95.89
LED-G  (via drill 0.3)
  Top 0.406: v148.59,77.79 R105.1
  Bottom 0.406: IC101.2 112.39,77.47 113.67,78.74 139.06,78.74 140.02,77.79 v148.59,77.79
LED-R  (via drill 0.3)
  Top 0.406: v150.5,71.12 150.5,81.92 R104.1
  Bottom 0.406: IC101.4 111.76,72.39 113.03,71.12 v150.5,71.12
MISO  (via drill 0.3)
  Top 0.406: v135.25,67.31 v135.25,63.5 v135.25,36.83 | SV101.1 v113.03,86.36 | v119.06,86.36 v119.06,64.77
  Bottom 0.406: IC101.7 v119.06,64.77 122.56,64.77 123.83,63.5 v135.25,63.5 | v135.25,67.31 IC104.15 | v113.03,86.36 v119.06,86.36 | v135.25,36.83 IC103.2
MOSI  (via drill 0.3)
  Top 0.406: SV101.4 116.84,90.17 116.84,80.01 117.79,79.06 v117.79,67.31 | v133.35,31.75 v133.35,66.04
  Bottom 0.406: IC101.6 v117.79,67.31 122.24,67.31 123.51,66.04 v133.35,66.04 134.94,66.04 136.21,64.77 IC104.14 | IC103.5 v133.35,31.75
N$1
  Top 0.406: C103.1 106.36,45.85 Q101.1
  Bottom 0.406: IC101.13 105.73,49.53 105.09,48.9 Q101.1
N$2  (via drill 0.3)
  Top 1.27: 47.05,67.25 46.99,67.31 | 46.99,67.31 46.99,67.63 47.94,68.58 R309.1 48.42,68.74 50.16,70.48 59.69,70.48 63.5,74.3 63.5,80.96 64.45,81.92 Q303.3 | C309.1 46.99,67.31 | Q304.B v39.69,83.19
  Bottom 1.27: T302.3 74.93,82.55 74.3,83.19 66.99,83.19 | 66.99,83.19 Q303.3 66.99,82.55 | v39.69,83.19 66.99,83.19
N$3
  Top 1.27: Q303.2 69.53,80.64 69.85,80.96 69.85,87.63 69.22,88.27 45.4,88.27 44.77,87.63 Q304.E 44.77,71.12 42.23,68.58 R312.1
N$4  (via drill 0.3)
  Top 1.27: T303.2 71.12,70.8 71.75,71.44 71.75,88.58 70.17,90.17 37.47,90.17 35.56,88.27 v35.56,62.1 | Q305.E 44.77,58.1 R313.2
  Bottom 1.27: v35.56,62.1 40.77,62.1 R313.2
N$5
  Top 0.406: C102.1 106.36,54.29 105.09,53.02 Q101.2
  Bottom 0.406: IC101.12 105.22,52.07 Q101.2
N$6
  Top 0.406: C105.1 132.21,46.48 Q102.2 129.22,49.85 128.59,50.48 128.59,56.52 129.22,57.15 IC104.8
N$7  (via drill 0.3)
  Top 0.406: C106.1 137.03,46.48 Q102.1 136.21,50.67 v136.21,59.69
  Bottom 0.406: IC104.7 v136.21,59.69
N$8  (via drill 0.3)
  Top 1.27: C309.2 R310.2 | R310.2 48.9,63.18 49.85,64.14 61.59,64.14 63.5,66.04 63.5,70.17 65.41,72.07 T303.3 | Q305.B v39.69,53.66 | v48.9,53.66 R310.2
  Bottom 1.27: Q302.3 74.93,73.03 74.61,73.34 67.31,73.34 66.99,73.03 T303.3 | v39.69,53.66 v48.9,53.66
N$9  (via drill 0.3)
  Top 0.406: v122.56,77.47 v122.56,83.5
  Bottom 0.406: IC101.39 v122.56,77.47 | v122.56,83.5 110.17,83.5 103.82,89.85 R106.2
N$10  (via drill 0.3)
  Top 0.406: R311.1 72.07,22.86 72.07,22.54
  Top 0.813: T301.2 72.07,22.54 C308.1 | IC302.3 v81.6,19.05
  Bottom 0.813: C308.1 v81.6,19.05 83.82,19.05 84.14,19.37 IC302.5
N$11  (via drill 0.3)
  Top 0.406: IC301.2 v84.77,49.21 87.31,51.75 IC301.6 | v79.69,49.21 79.69,35.88 77.47,33.66 77.47,24.45 77.79,24.13 77.79,17.14 79.06,15.88 IC302.2
  Bottom 0.406: v84.77,49.21 v79.69,49.21
  Bottom 0.61: IC302.1 IC302.2
N$15  (via drill 0.3)
  Top 0.406: v70.17,50.8 v70.17,60.64
  Bottom 0.406: IC301.5 89.85,51.44 89.22,50.8 v70.17,50.8 | v70.17,60.64 R305.1
N$16  (via drill 0.3)
  Top 0.61: v91.76,73.03 91.76,46.35 92.08,46.04 92.08,39.37 93.34,38.1 v93.34,24.13
  Bottom 0.61: T302.1 76.83,79.38 81.92,74.3 Q301.1 82.87,73.03 | Q302.1 75.25,69.22 81.6,69.22 82.87,70.48 82.87,73.03 | v91.76,73.03 82.87,73.03 | v93.34,24.13 82.23,24.13 81.6,23.5 IC302.6 IC302.7
N$17
  Top 0.61: Q301.3 80.33,76.83 76.83,73.34 Q302.2 78.42,69.22 78.42,63.82 77.79,63.18 75.88,63.18 74.61,61.91 74.61,58.74 75.25,58.1 R307.2
  Bottom 0.61: T302.2 81.92,80.64 82.87,79.69 Q301.3
N$18  (via drill 0.3)
  Top 0.61: R306.2 87.95,58.1 87.31,58.74 v87.31,75.56
  Bottom 0.61: v87.31,75.56 Q301.2
N$19  (via drill 0.3)
  Top 0.406: v87.31,39.05 IC301.3
  Top 0.61: R308.2 v66.36,51.75 63.5,51.75 63.18,51.44 63.18,43.81 66.04,40.96 C306.-
  Bottom 0.406: C306.- 78.58,39.53 79.06,39.05 v87.31,39.05 | R303.2 73.98,52.7 73.03,51.75 v66.36,51.75
N$20
  Bottom 0.61: R308.1 61.28,44.77 56.2,39.69 D306.A
N$22
  Top 0.406: R306.1 82.87,58.1 84.77,56.2 IC301.7
  Bottom 0.406: D302.C 77.79,53.66 79.06,52.39 84.14,52.39 84.77,53.02 IC301.7
N$23
  Bottom 0.406: R104.2 151.13,91.44 154.31,88.27 D101.AR
N$24
  Top 0.406: IC301.1 D303.C
N$25  (via drill 0.3)
  Top 0.406: D301.A D303.A | v94.61,43.5 v94.61,47.15
  Bottom 0.406: R302.1 68.9,43.18 69.85,42.23 88.58,42.23 D303.A v94.61,43.5 | v94.61,47.15 C301.+
N$26  (via drill 0.3)
  Top 0.406: R302.2 v68.9,48.26 | v77.15,48.26 D302.A
  Bottom 0.406: v68.9,48.26 v77.15,48.26 | R302.2 R301.1
N$27
  Bottom 0.406: R105.2 148.59,88.58 153.99,83.19 D101.AG
N$29  (via drill 0.3)
  Top 0.406: IC105.1 133.03,88.58 134.3,87.31 v134.3,74.93
  Bottom 0.406: v134.3,74.93 IC104.1
N$30  (via drill 0.3)
  Top 0.406: v133.03,72.39 v133.03,80.96
  Bottom 0.406: IC104.2 v133.03,72.39 | v133.03,80.96 IC105.4
N$32
  Bottom 0.406: OK101.3 144.78,91.44 143.51,92.71 R111.1
N$33  (via drill 0.3)
  Top 0.406: OK101.1 142.24,79.38 143.83,77.79 143.83,69.22 | 143.83,69.22 R112.2 | v143.83,66.67 143.83,69.22
  Bottom 0.406: X102.3 155.83,63.12 156.21,63.5 156.21,65.41 154.94,66.67 v143.83,66.67
N$36
  Top 1.27: R212.1 R211.1 R210.1 D208.C 134.94,15.56 133.67,16.83 133.67,22.23 | D206.C 134.94,25.72 133.67,24.45 133.67,22.23 | 133.67,22.23 OK202.4
N$37
  Bottom 1.27: OK201.2 109.22,8.89 111.12,10.79 116.52,10.79 D203.C
N$38
  Bottom 1.27: OK201.3 111.76,7.94 112.71,8.89 R201.1
N$39  (via drill 0.3)
  Top 0.61: v89.53,31.75 R202.1 | D205.C v83.82,31.75
  Bottom 0.61: L201.1 67.98,32.98 69.53,31.75 C201.1 v83.82,31.75 v89.53,31.75 | R202.1 D204.A
N$41  (via drill 0.3)
  Top 0.406: OK201.6 v111.76,17.46 | v99.38,17.46 v99.38,11.43 | v90.81,11.43 90.81,7.94 | 90.81,7.94 90.81,7.3 91.12,6.99 R203.2 | T201.2 90.49,8.26 90.81,7.94
  Bottom 0.406: v111.76,17.46 v99.38,17.46 | v99.38,11.43 v90.81,11.43
N$42  (via drill 0.3)
  Top 1.27: v143.83,4.76 143.83,18.1 144.46,18.73 D209.A
  Bottom 1.27: D207.A D209.A | Q201.E 132.08,5.71 133.03,4.76 v143.83,4.76
N$43  (via drill 0.3)
  Top 0.406: R205.2 92.08,23.81 93.03,22.86 93.03,16.51 94.3,15.24 IC201.3
  Top 0.61: D204.C v86.36,29.21 | D205.A v83.82,29.21 | v92.08,29.21 R205.2 | R206.1 v97.16,29.21
  Bottom 0.61: L201.2 67.94,27.94 68.26,27.94 69.53,29.21 C201.2 v83.82,29.21 v86.36,29.21 v92.08,29.21 v97.16,29.21
N$44
  Top 0.406: IC201.2 91.76,14.92 90.49,16.19 90.49,24.13 90.81,24.45 90.81,35.24 R202.2
  Bottom 0.406: R202.2 R204.1 R205.1
N$45
  Top 0.813: Q201.B 132.08,16.83 129.22,19.68 OK202.3
N$46
  Bottom 1.27: R212.2 R211.2 R210.2 142.56,11.43 140.65,13.34 135.25,13.34 133.35,11.43 Q201.C
N$50
  Top 0.406: OK202.1 R208.1
N$55
  Bottom 0.406: R107.2 152.4,78.42 153.35,79.38 156.37,79.38 D102.AR
N$56
  Bottom 0.406: R108.2 153.99,73.98 154.62,74.61 156.37,74.61 D102.AG
ON-P  (via drill 0.3)
  Top 0.406: R304.1 R305.2 | v122.87,73.66 v122.87,46.99 | v98.74,45.09 v98.74,59.37 | OK201.7 109.22,26.99 107.95,28.26 107.95,45.72 109.22,46.99 IC101.14
  Bottom 0.406: R108.1 141.92,73.98 141.6,73.66 v122.87,73.66 | v122.87,46.99 IC101.14 109.22,46.99 107.31,45.09 v98.74,45.09 | v98.74,59.37 81.28,59.37 R304.1
PULSE-P  (via drill 0.3)
  Top 0.406: IC101.16 112.39,41.91 113.03,41.27 v113.03,19.68 | IC201.7 v91.76,19.68
  Bottom 0.406: v113.03,19.68 OK202.2 v91.76,19.68
PWM-P  (via drill 0.3)
  Top 0.406: v114.3,38.1 v114.3,31.75 | v100.33,38.1 100.33,69.53 99.69,70.17 X101.1
  Bottom 0.406: v100.33,38.1 v114.3,38.1 | v114.3,31.75 IC101.21
SCK  (via drill 0.3)
  Top 0.406: SV101.3 115.57,80.01 116.52,79.06 v116.52,62.23 | v134.3,34.29 v134.3,60.96
  Bottom 0.406: IC101.8 v116.52,62.23 122.24,62.23 123.51,60.96 v134.3,60.96 135.57,60.96 136.84,62.23 IC104.13 | IC103.6 v134.3,34.29
SHORT-P  (via drill 0.3)
  Top 0.406: v102.87,39.37 R209.1
  Bottom 0.406: IC101.17 v102.87,39.37 88.58,39.37 87,40.96 D301.C
SPG  (via drill 0.3)
  Top 0.406: v120.97,80.01 v120.97,38.1 | v142.24,38.1 R110.1
  Bottom 0.406: R109.2 R110.1 | IC101.40 v120.97,80.01 | v120.97,38.1 v142.24,38.1
TRACK-0-E  (via drill 0.3)
  Top 1.016: X102.1 154.62,65.41 153.67,66.36 150.5,66.36 149.86,65.72 v149.86,46.04 v149.86,28.89
  Bottom 1.016: X103.1 154.56,45.15 153.67,46.04 v149.86,46.04
  Bottom 1.27: X202.1 150.02,29.05 v149.86,28.89 149.54,28.57 149.54,26.99 | 149.54,26.99 147.32,26.99 D206.A 144.15,25.72 140.97,22.54 D207.C 134.94,22.54 128.59,16.19 123.83,16.19 123.19,15.56 123.19,9.53 123.83,8.89 R201.2 | X201.1 150.5,16.83 149.54,17.78 149.54,26.99
TRACK-B-E
  Top 1.016: X202.2 151.61,23.97 151.13,24.45 151.13,44.13 | 151.13,44.13 151.13,63.82 151.45,64.14 X102.2 | X103.2 151.13,44.13
  Bottom 1.27: X202.2 157,23.97 158.43,22.54 158.43,13.65 156.53,11.75 X201.2 149.86,11.75 D208.A 144.46,15.56 141.29,18.73 D209.C 133.67,18.73 128.27,13.34 D203.A
V+
  Top 1.27: V301.IN 18.1,32.07 21.11,35.08 21.11,67.79 21.91,68.58 R312.2
  Bottom 1.27: V301.IN C304.1 22.23,20.95 D304.C 37.15,20.95 38.89,19.21 C302.+ | R312.2 25.88,69.69 26.67,70.48 57.31,70.48 57.39,70.41 | 57.39,70.41 R309.2 | Q303.1 66.99,77.79 59.69,70.48 57.47,70.48 57.39,70.41
V-  (via drill 0.3)
  Top 0.813: C305.2 46.99,13.97 v48.26,12.7
  Top 1.27: C303.- 57.78,6.67 56.2,5.08 32.23,5.08 30.16,7.14 30.16,33.02 23.65,39.53 23.65,61.12 24.45,61.91 R313.1
  Bottom 1.27: D305.A 16.83,9.05 20.64,12.7 v48.26,12.7 54.61,12.7 57.63,9.84 C303.- | R313.1 25.72,60.96 26.67,60.01 57.15,60.01 R310.1 59.37,61.91 T303.1

### Text on the board
tNames: HW: 24.05.01 | MBCAN-Projekt | (c) Dr.-Ing. Th. Wiesner | OUT | IN | B | 0 | 0 | B | L | 0 | 0 | B | mbc-93